# Altium project Ezlo_Voice_AssistantHUB.PrjPcb (part 4 of 10)

## Sheet Power_Sheet_3.SchDoc
size A4; DocumentNumber: 5; SheetNumber: 5; SheetTotal: 27
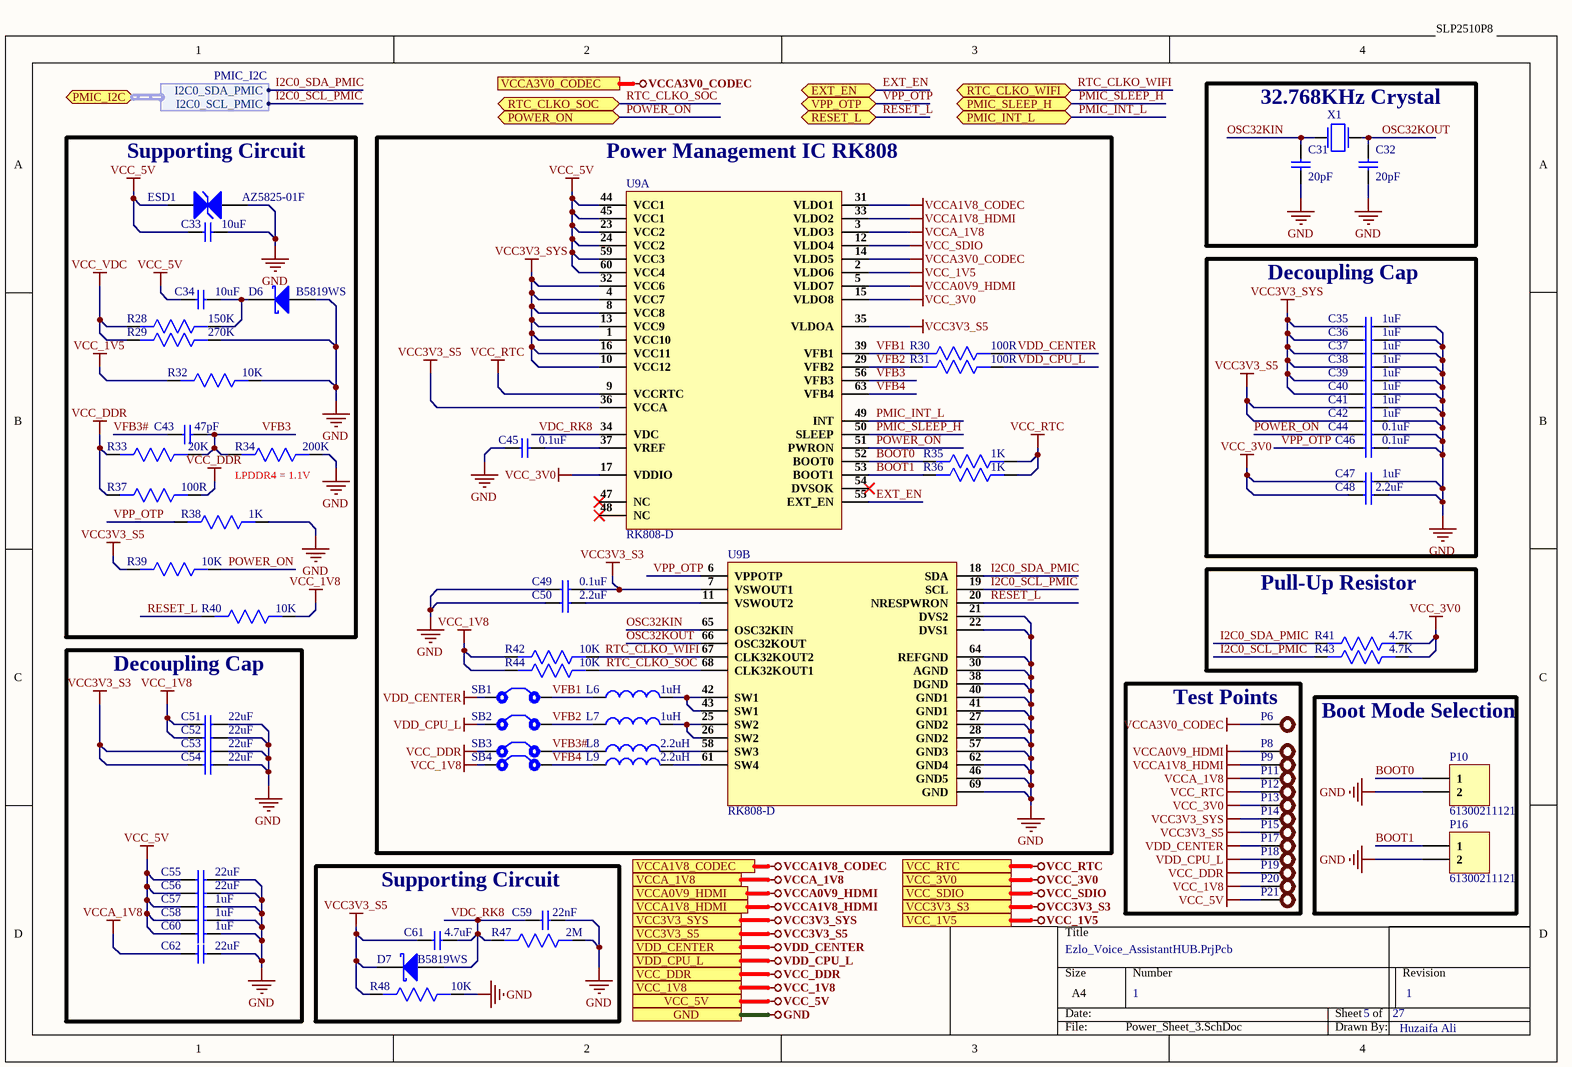
[diagram p6: Power_Sheet_3.SchDoc]

### Parts
C31  20pF  [Cap0603]
C32  20pF  [Cap0603]
C33  10uF  [Cap0603]
C34  10uF  [Cap0603]
C35  1uF  [Cap0402]
C36  1uF  [Cap0402]
C37  1uF  [Cap0402]
C38  1uF  [Cap0402]
C39  1uF  [Cap0402]
C40  1uF  [Cap0402]
C41  1uF  [Cap0402]
C42  1uF  [Cap0402]
C43  47pF  [Cap0603]
C44  0.1uF  [Cap 0402]
C45  0.1uF  [Cap0402]
C46  0.1uF  [Cap 0402]
C47  1uF  [Cap0402]
C48  2.2uF  [Cap0603]
C49  0.1uF  [Cap0402]
C50  2.2uF  [Cap0603]
C51  22uF  [Cap0805]
C52  22uF  [Cap0805]
C53  22uF  [Cap0805]
C54  22uF  [Cap0805]
C55  22uF  [Cap0805]
C56  22uF  [Cap0805]
C57  1uF  [Cap0402]
C58  1uF  [Cap0402]
C59  22nF  [Cap0603]
C60  1uF  [Cap0402]
C61  4.7uF  [Cap0603]
C62  22uF  [Cap0805]
D6  B5819WS  [SOD-323]
D7  B5819WS  [SOD-323]
ESD1  AZ5825-01F  [DFN1006-2L]
L6  1uH  [PSPMAA0412-1R0M-ANP]
L7  1uH  [PSPMAA0412-1R0M-ANP]
L8  2.2uH  [MHP0302-2R2M]
L9  2.2uH  [MHP0302-2R2M]
P6  TEST POINT  [TEST POINT]  (value not drawn)
P8  TEST POINT  [TEST POINT]  (value not drawn)
P9  TEST POINT  [TEST POINT]  (value not drawn)
P10  61300211121  [HDR1X2]
P11  TEST POINT  [TEST POINT]  (value not drawn)
P12  TEST POINT  [TEST POINT]  (value not drawn)
P13  TEST POINT  [TEST POINT]  (value not drawn)
P14  TEST POINT  [TEST POINT]  (value not drawn)
P15  TEST POINT  [TEST POINT]  (value not drawn)
P16  61300211121  [HDR1X2]
P17  Test Point  [TEST POINT]  (value not drawn)
P18  Test Point  [TEST POINT]  (value not drawn)
P19  Test Point  [TEST POINT]  (value not drawn)
P20  Test Point  [TEST POINT]  (value not drawn)
P21  Test Point  [TEST POINT]  (value not drawn)
R28  150K  [Res0603]
R29  270K  [Res0603]
R30  100R  [Res0603]
R31  100R  [Res0603]
R32  10K  [Res0603]
R33  20K  [Res0603]
R34  200K  [Res0603]
R35  1K  [Res0603]
R36  1K  [Res0603]
R37  100R  [Res0603]
R38  1K  [Res0603]
R39  10K  [Res0603]
R40  10K  [Res0603]
R41  4.7K  [Res0603]
R42  10K  [Res0603]
R43  4.7K  [Res0603]
R44  10K  [Res0603]
R47  2M  [Res0603]
R48  10K  [Res0603]
SB1  Solder Bridge  [Solder Bridge]  (value not drawn)
SB2  Solder Bridge  [Solder Bridge]  (value not drawn)
SB3  Solder Bridge  [Solder Bridge]  (value not drawn)
SB4  Solder Bridge  [Solder Bridge]  (value not drawn)
U9  RK808-D  [68-QFN (7x7)]  (parts A,B of 2)
X1  NX3215SA-32.768K-STD-MUA-8  [NX3215SA-32.768K-STD-MUA-8]  (value not drawn)

### Blocks framed on the sheet
32.768KHz Crystal: C31 C32 X1
Supporting Circuit: C33 C34 C43 D6 ESD1 R28 R29 R32-R34 R37-R40
Power Management IC RK808: C45 C49 C50 L6-L9 R30 R31 R35 R36 R42 R44 SB1-SB4 U9
Decoupling Cap: C35-C42 C44 C46-C48
Pull-Up Resistor: R41 R43
Decoupling Cap: C51-C58 C60 C62
Test Points: P6 P8 P9 P11-P15 P17-P21
Boot Mode Selection: P10 P16
Supporting Circuit: C59 C61 D7 R47 R48

### Ports
EXT_EN (bidir), GND, PMIC_I2C (bidir, harness PMIC_I2C), PMIC_INT_L (bidir), PMIC_SLEEP_H (bidir), POWER_ON (bidir), RESET_L (bidir), RTC_CLKO_SOC (bidir), RTC_CLKO_WIFI (bidir), VCC3V3_S3, VCC3V3_S5, VCC3V3_SYS, VCC_1V5, VCC_1V8, VCC_3V0, VCC_5V, VCC_DDR, VCC_RTC, VCC_SDIO, VCCA0V9_HDMI, VCCA1V8_CODEC, VCCA1V8_HDMI, VCCA3V0_CODEC, VCCA_1V8, VDD_CENTER, VDD_CPU_L, VPP_OTP (bidir)

### Harnesses
PMIC_I2C: I2C0_SDA_PMIC, I2C0_SCL_PMIC

### Nets
GND: C31.1 C32.1 C33.2 C35.2 C36.2 C37.2 C38.2 C39.2 C40.2 C41.2 C42.2 C44.2 C45.1 C46.2 C47.2 C48.2 C49.1 C50.1 C51.2 C52.2 C53.2 C54.2 C55.2 C56.2 C57.2 C58.2 C59.2 C60.2 C62.2 D6.2(A) ESD1.2(k) P10.2 P16.2 R29.1 R32.1 R34.1 R38.1 R47.1 R48.1 U9.21(DVS2) U9.22(DVS1) U9.27(GND2) U9.28(GND2) U9.30(AGND) U9.38(DGND) U9.40(GND1) U9.41(GND1) U9.46(GND5) U9.57(GND3) U9.62(GND4) U9.64(REFGND) U9.69(GND) ; port GND
VCC3V3_S3: C49.2 C53.1 C54.1 U9.7(VSWOUT1) ; port VCC3V3_S3
VCC3V3_S5: C41.1 C42.1 C61.1 D7.1(K) P15.1 R39.2 R48.2 U9.35(VLDOA) U9.36(VCCA) ; port VCC3V3_S5
VCC3V3_SYS: C35.1 C36.1 C37.1 C38.1 C39.1 C40.1 P14.1 U9.1(VCC10) U9.4(VCC7) U9.8(VCC8) U9.10(VCC12) U9.13(VCC9) U9.16(VCC11) U9.32(VCC6) ; port VCC3V3_SYS
VCC_1V5: R32.2 U9.2(VLDO6) ; port VCC_1V5
VCC_1V8: C51.1 C52.1 P20.1 R40.1 R42.2 R44.2 SB4.1 ; port VCC_1V8
VCC_3V0: C47.1 C48.1 P13.1 R41.1 R43.1 U9.15(VLDO8) U9.17(VDDIO) ; port VCC_3V0
VCC_5V: C33.1 C34.1 C55.1 C56.1 C57.1 C58.1 C60.1 ESD1.1(K) P21.1 U9.23(VCC2) U9.24(VCC2) U9.44(VCC1) U9.45(VCC1) U9.59(VCC3) U9.60(VCC4) ; port VCC_5V
VCC_DDR: P19.1 R33.2 R37.1 R37.2 SB3.1 ; port VCC_DDR
VCC_RTC: P12.1 R35.1 R36.1 U9.9(VCCRTC) ; port VCC_RTC
VCC_SDIO: U9.12(VLDO4) ; port VCC_SDIO
VCC_VDC: R28.2 R29.2
VCCA0V9_HDMI: P8.1 U9.5(VLDO7) ; port VCCA0V9_HDMI
VCCA1V8_CODEC: U9.31(VLDO1) ; port VCCA1V8_CODEC
VCCA1V8_HDMI: P9.1 U9.33(VLDO2) ; port VCCA1V8_HDMI
VCCA3V0_CODEC: P6.1 U9.14(VLDO5) ; port VCCA3V0_CODEC
VCCA_1V8: C62.1 P11.1 U9.3(VLDO3) ; port VCCA_1V8
VDD_CENTER: P17.1 R30.1 SB1.1 ; port VDD_CENTER
VDD_CPU_L: P18.1 R31.1 SB2.1 ; port VDD_CPU_L
BOOT0: P10.1 R35.2 U9.52(BOOT0)
BOOT1: P16.1 R36.2 U9.53(BOOT1)
EXT_EN: U9.55(EXT_EN) ; port EXT_EN
I2C0_SCL_PMIC: R43.2 U9.19(SCL) ; port PMIC_I2C.I2C0_SCL_PMIC
I2C0_SDA_PMIC: R41.2 U9.18(SDA) ; port PMIC_I2C.I2C0_SDA_PMIC
OSC32KIN: C31.2 U9.65(OSC32KIN) X1.2
OSC32KOUT: C32.2 U9.66(OSC32KOUT) X1.1
PMIC_INT_L: U9.49(INT) ; port PMIC_INT_L
PMIC_SLEEP_H: U9.50(SLEEP) ; port PMIC_SLEEP_H
POWER_ON: C44.1 R39.1 U9.51(PWRON) ; port POWER_ON
RESET_L: R40.2 U9.20(NRESPWRON) ; port RESET_L
RTC_CLKO_SOC: R44.1 U9.68(CLK32KOUT1) ; port RTC_CLKO_SOC
RTC_CLKO_WIFI: R42.1 U9.67(CLK32KOUT2) ; port RTC_CLKO_WIFI
VDC_RK8: C59.1 C61.2 D7.2(A) R47.2 U9.34(VDC)
VFB1: L6.1 R30.2 SB1.2 U9.39(VFB1)
VFB2: L7.1 R31.2 SB2.2 U9.29(VFB2)
VFB3: C43.2 R33.1 R34.2 U9.56(VFB3)
VFB3#: C43.1 L8.1 SB3.2
VFB4: L9.1 SB4.2 U9.63(VFB4)
VPP_OTP: C46.1 R38.2 U9.6(VPPOTP) ; port VPP_OTP
NetC34_2: C34.2 D6.1(K) R28.1
NetC45_2: C45.2 U9.37(VREF)
NetC50_2: C50.2 U9.11(VSWOUT2)
NetL6_2: L6.2 U9.42(SW1) U9.43(SW1)
NetL7_2: L7.2 U9.25(SW2) U9.26(SW2)
NetL8_2: L8.2 U9.58(SW3)
NetL9_2: L9.2 U9.61(SW4)

Not connected (* = marked no-connect by the designer): U9 47(NC)* 48(NC)* 54(DVSOK)*

### Notes on the sheet
- SLP2510P8
- (near R34) LPDDR4 = 1.1V
- 1
- Huzaifa Ali

### Library data of the parts
C31 C32 = CC0603JRNPO9BN200: CAP CER 20PF 50V C0G/NPO 0603; Manufacturer: Yageo; Tolerance: 5%; Dielectric: C0G; Supplier 1: Digi-Key; Manufacturer Part Number: CC0603JRNPO9BN200; Stock 1: 259568; Pricing 1: 1=0.1, 10=0.048, 100=0.0214, 500=0.01526, 1000=0.01198 (USD); Mount: Surface Mount; Case/Package: 0603; Number of Pins: 2; Weight: 7.1E-05oz; Case Code (Imperial): 0603; Case Code (Metric): 1608; Min Operating Temperature: -55°C; Max Operating Temperature: 125°C; Capacitance: 20pF; Package Quantity: 4000; Voltage Rating (DC): 50V; Packaging: Tape and Reel; Voltage Rating: 50V; Termination: SMD/SMT; Composition: Ceramic; Length: 1.6mm; Width: 0.8mm; Thickness: 0.035inch; Depth: 0.8mm; REACH SVHC: Unknown; Lead Free: Lead Free; ComponentLink1URL: http://www.farnell.com/datasheets/1132289.pdf?src-supplier=Element14; ComponentLink1Description: http://www.farnell.com/datasheets/1132289.pdf?src-supplier=Element14; ComponentLink2URL: http://www.yageo.com/documents/recent/UPY-GP_NP0_16V-to-50V_16.pdf?src-supplier=Digi-Key; ComponentLink2Description: http://www.yageo.com/documents/recent/UPY-GP_NP0_16V-to-50V_16.pdf?src-supplier=Digi-Key; Supplier Part Number 1: 311-1424-6-ND
C33 C34 = C1608X5R1E106M080AC: CAP CER 10UF 25V X5R 0603; Manufacturer: TDK; Dielectric Material: Ceramic; Tolerance: 20%; Supplier 1: Digi-Key; Manufacturer Part Number: C1608X5R1E106M080AC; Stock 1: 61681; Pricing 1: 1=0.96, 10=0.704, 100=0.483, 500=0.38238, 1000=0.322 (USD); Mount: Surface Mount; Case/Package: 0603; Weight: 7.1E-05oz; Case Code (Imperial): 0603; Case Code (Metric): 1608; Min Operating Temperature: -55°C; Max Operating Temperature: 85°C; Capacitance: 10uF; Packaging: Tape and Reel; Voltage Rating: 25V; Voltage Rating (DC): 25V; Termination: SMD/SMT; Package Quantity: 1; Dielectric: X5R; Composition: Ceramic; Length: 1.6mm; Height: 0.8mm; Width: 0.8mm; Thickness: 0.039inch; Depth: 0.8mm; Lead Free: Lead Free; REACH SVHC: No SVHC; Supplier Part Number 1: 445-9015-1-ND
C35-C42 C47 C57 C58 C60 = GRM155R61E105KA12D: CAP CER 1UF 25V X5R 0402; Manufacturer: Murata; Material: Ceramic; Tolerance: 10%; Supplier 1: Digi-Key; Manufacturer Part Number: GRM155R61E105KA12D; Stock 1: 1194305; Pricing 1: 1=0.11, 10=0.077, 100=0.0363, 500=0.02546, 1000=0.02108, 2500=0.01962, 5000=0.01795 (USD); Mount: Surface Mount; Case/Package: 0402; Weight: 0.000212oz; Case Code (Metric): 1005; Case Code (Imperial): 0402; Min Operating Temperature: -55°C; Max Operating Temperature: 85°C; Capacitance: 1uF; Voltage Rating: 25V; Packaging: Tape and Reel; Dielectric: X5R; Voltage: 25V; Termination: SMD/SMT; Voltage Rating (DC): 25V; Package Quantity: 10000; Length: 1mm; Height: 0.5mm; Width: 0.5mm; Thickness: 0.022inch; Depth: 0.5mm; REACH SVHC: No SVHC; Lead Free: Lead Free; ComponentLink1URL: http://www.farnell.com/datasheets/2048341.pdf?src-supplier=Element14; ComponentLink1Description: http://www.farnell.com/datasheets/2048341.pdf?src-supplier=Element14; Supplier Part Number 1: 490-10017-1-ND
C43 = AC0603JRNPO0BN470: CAP CER 47PF 100V NPO 0603; Manufacturer: Yageo; Zener Voltage: 33V; Tolerance: 6.06%; Max Power Dissipation: 250mW; Impedance: 80R; Supplier 1: Digi-Key; Manufacturer Part Number: AC0603JRNPO0BN470; Stock 1: 4954; Pricing 1: 1=0.16, 10=0.115, 100=0.0542, 500=0.03798, 1000=0.03144 (USD); Mount: Surface Mount; Case/Package: TO-236-3; Case Code (Imperial): 0603; Case Code (Metric): 1608; Min Operating Temperature: -55°C; Max Operating Temperature: 125°C; Packaging: Tape and Reel; Capacitance: 47pF; Voltage Rating: 100V; Ratings: AEC-Q200; ComponentLink1URL: http://www.yageo.com/NewPortal/_en/search/productDocs.jsp?YageoPartNumber=AC0603JRNPO0BN470&src-supplier=Digi-Key; ComponentLink1Description: http://www.yageo.com/NewPortal/_en/search/productDocs.jsp?YageoPartNumber=AC0603JRNPO0BN470&src-supplier=Digi-Key; Supplier Part Number 1: 311-3086-1-ND
C44 C46 = GRM155R71H104ME14D: CAP CER 0.1UF 50V X7R 0402; Manufacturer: Murata; Tolerance: 20%; Capacitance: 100nF; Supplier 1: Digi-Key; Manufacturer Part Number: GRM155R71H104ME14D; Stock 1: 439844; Pricing 1: 1=0.1, 10=0.038, 100=0.0168, 500=0.01198, 1000=0.00941, 2500=0.00855, 5000=0.00787 (USD); Mount: Surface Mount; Case/Package: 0402; Min Operating Temperature: -55°C; Max Operating Temperature: 125°C; Packaging: Cut Tape; Voltage Rating: 50V; Length: 0.039inch; Width: 0.02inch; Thickness: 0.022inch; ComponentLink1URL: http://search.murata.co.jp/Ceramy/image/img/A01X/G101/ENG/GRM155R71H104ME14-01.pdf?src-supplier=Digi-Key; ComponentLink1Description: http://search.murata.co.jp/Ceramy/image/img/A01X/G101/ENG/GRM155R71H104ME14-01.pdf?src-supplier=Digi-Key; ComponentLink2URL: http://psearch.en.murata.com/capacitor/product/GRM155R71H104ME14%23.pdf?src-supplier=Avnet; ComponentLink2Description: http://psearch.en.murata.com/capacitor/product/GRM155R71H104ME14%23.pdf?src-supplier=Avnet; ComponentLink3URL: http://components.arrow.com/part/dataview/0323_07177683?src-supplier=Arrow+Europe; ComponentLink3Description: http://components.arrow.com/part/dataview/0323_07177683?src-supplier=Arrow+Europe; ComponentLink4URL: http://www.mouser.com/ds/2/281/c02e-2905.pdf?src-supplier=Mouser; ComponentLink4Description: http://www.mouser.com/ds/2/281/c02e-2905.pdf?src-supplier=Mouser; Supplier Part Number 1: 490-10701-1-ND
C45 C49 = CC0402KRX5R6BB104: CAP CER 0.1UF 10V X5R 0402; Manufacturer: Yageo; Capacitance: 100nF; Tolerance: 10%; Dissipation Factor: 5%; Insulation Resistance: 10GR; Supplier 1: Digi-Key; Manufacturer Part Number: CC0402KRX5R6BB104; RoHS: Yes; Category: Ceramic Capacitors; Stock 1: 6385580; Pricing 1: 1=0.10000, 10=0.02700, 50=0.01500, 100=0.01220, 500=0.00874, 1000=0.00687, 2500=0.00625, 5000=0.00575 (USD); Mount: Surface Mount; Case/Package: 0402; Number of Pins: 2; Case Code (Imperial): 0402; Case Code (Metric): 1005; Min Operating Temperature: -55°C; Max Operating Temperature: 85°C; Dielectric: X5R; Packaging: Tape and Reel; Voltage Rating: 10V; Package Quantity: 1; Termination: SMD/SMT; Voltage Rating (DC): 10V; Series: CC; Length: 1mm; Width: 0.02inch; Height: 0.5mm; Depth: 0.5mm; Thickness: 0.022inch; Radiation Hardening: No; RoHS Compliant: Yes; REACH SVHC: No SVHC; Lead Free: Lead Free; Halogen Free: Halogen Free; ComponentLink1URL: https://datasheet.ciiva.com/144/mlccorderingcode-144029.pdf?src-supplier=Digi-Key; ComponentLink1Description: https://datasheet.ciiva.com/144/mlccorderingcode-144029.pdf?src-supplier=Digi-Key; ComponentLink2URL: https://datasheet.ciiva.com/144/mlccorderingcode-144028.pdf?src-supplier=Digi-Key; ComponentLink2Description: https://datasheet.ciiva.com/144/mlccorderingcode-144028.pdf?src-supplier=Digi-Key; ComponentLink3URL: https://datasheet.ciiva.com/144/mlccorderingcode-144030.pdf?src-supplier=Digi-Key; ComponentLink3Description: https://datasheet.ciiva.com/144/mlccorderingcode-144030.pdf?src-supplier=Digi-Key; ComponentLink4URL: https://datasheet.ciiva.com/7978/1359354-7978091.pdf?src-supplier=Element14; ComponentLink4Description: https://datasheet.ciiva.com/7978/1359354-7978091.pdf?src-supplier=Element14; ComponentLink5URL: https://datasheet.ciiva.com/11587/upy-gphc-x5r-4v-to-50v-12-11587302.pdf?src-supplier=Avnet; ComponentLink5Description: https://datasheet.ciiva.com/11587/upy-gphc-x5r-4v-to-50v-12-11587302.pdf?src-supplier=Avnet; Supplier Part Number 1: 311-1336-1-ND
C48 C50 = CL10A225KA8NNNC: CAP CER 2.2UF 25V X5R 0603; Manufacturer: Samsung; Tolerance: 10%; Supplier 1: Digi-Key; Manufacturer Part Number: CL10A225KA8NNNC; RoHS: Yes; Category: Ceramic Capacitors; Stock 1: 168888; Pricing 1: 1=0.22000, 10=0.15000, 50=0.09000, 100=0.07610, 500=0.05206, 1000=0.04605 (USD); Mount: Surface Mount; Case/Package: 0603; Case Code (Metric): 1608; Case Code (Imperial): 0603; Min Operating Temperature: -55°C; Max Operating Temperature: 85°C; Capacitance: 2.2uF; Packaging: Tape and Reel; Package Quantity: 1; Voltage Rating: 25V; Dielectric: X5R; Voltage Rating (DC): 25V; Series: CL; Construction: Flat; Length: 1.6mm; Width: 0.031inch; Height: 0.8mm; Thickness: 0.035inch; Depth: 0.8mm; Radiation Hardening: No; Lead Free: Lead Free; RoHS Compliant: Yes; ComponentLink1URL: https://datasheet.ciiva.com/25797/cl10a225ka8nnnc-25797781.pdf?src-supplier=Digi-Key; ComponentLink1Description: https://datasheet.ciiva.com/25797/cl10a225ka8nnnc-25797781.pdf?src-supplier=Digi-Key; Supplier Part Number 1: 1276-1879-1-ND
C51-C56 C62 = CL21A226MAYNNNE: 0803 22uF 25V X5R 20% multilayer ceramic capacitor; Manufacturer: Samsung; Supplier 1: Digi-Key; Manufacturer Part Number: CL21A226MAYNNNE; RoHS: Yes; Category: Ceramic Capacitors; Stock 1: 442950; Pricing 1: 2000=0.07687, 4000=0.07110, 10000=0.06726, 14000=0.06380, 50000=0.05765 (USD); RoHS Compliant: Yes; Supplier Part Number 1: 1276-CL21A226MAYNNNETR-ND
C59 = CC0603KRX7R9BB223: CAP CER 0.022UF 50V X7R 0603; Manufacturer: Yageo; Dielectric Material: Ceramic; Tolerance: 10%; Insulation Resistance: 100GR; Supplier 1: Digi-Key; Manufacturer Part Number: CC0603KRX7R9BB223; RoHS: Yes; Category: Ceramic Capacitors; Stock 1: 119735; Pricing 1: 1=0.10000, 10=0.05500, 50=0.03020, 100=0.02460, 500=0.01760, 1000=0.01383 (USD); Mount: Surface Mount; Case/Package: 0603; Number of Pins: 2; Case Code (Metric): 1608; Case Code (Imperial): 0603; Min Operating Temperature: -55°C; Max Operating Temperature: 125°C; Capacitance: 22nF; Dielectric: X7R; Voltage: 50V; Package Quantity: 1; Voltage Rating: 50V; Packaging: Tape and Reel; Voltage Rating (DC): 50V; Termination: SMD/SMT; Resistor Type: Ceramic; Series: CC; Length: 1.6mm; Width: 0.031inch; Height: 0.8mm; Depth: 0.8mm; Thickness: 0.035inch; Radiation Hardening: No; RoHS Compliant: Yes; REACH SVHC: No SVHC; Lead Free: Lead Free; Halogen Free: Halogen Free; ComponentLink1URL: https://datasheet.ciiva.com/8033/70765-8033869.pdf?src-supplier=Element14; ComponentLink1Description: https://datasheet.ciiva.com/8033/70765-8033869.pdf?src-supplier=Element14; ComponentLink2URL: https://datasheet.ciiva.com/28450/1489800-28450639.pdf?src-supplier=Element14; ComponentLink2Description: https://datasheet.ciiva.com/28450/1489800-28450639.pdf?src-supplier=Element14; ComponentLink3URL: https://datasheet.ciiva.com/8033/1489800-8033867.pdf?src-supplier=Element14; ComponentLink3Description: https://datasheet.ciiva.com/8033/1489800-8033867.pdf?src-supplier=Element14; ComponentLink4URL: https://datasheet.ciiva.com/8033/1489800-8033865.pdf?src-supplier=Element14; ComponentLink4Description: https://datasheet.ciiva.com/8033/1489800-8033865.pdf?src-supplier=Element14; ComponentLink5URL: https://datasheet.ciiva.com/156/mlccorderingcode-156178.pdf?src-supplier=Digi-Key; ComponentLink5Description: https://datasheet.ciiva.com/156/mlccorderingcode-156178.pdf?src-supplier=Digi-Key; ComponentLink6URL: https://datasheet.ciiva.com/156/mlccorderingcode-156177.pdf?src-supplier=Digi-Key; ComponentLink6Description: https://datasheet.ciiva.com/156/mlccorderingcode-156177.pdf?src-supplier=Digi-Key; ComponentLink7URL: https://datasheet.ciiva.com/156/mlccorderingcode-156179.pdf?src-supplier=Digi-Key; ComponentLink7Description: https://datasheet.ciiva.com/156/mlccorderingcode-156179.pdf?src-supplier=Digi-Key; ComponentLink8URL: https://datasheet.ciiva.com/11464/upy-gphc-x7r-6-3v-to-50v-8-11464741.pdf?src-supplier=Avnet; ComponentLink8Description: https://datasheet.ciiva.com/11464/upy-gphc-x7r-6-3v-to-50v-8-11464741.pdf?src-supplier=Avnet; Supplier Part Number 1: 311-1370-1-ND
C61 = CL10A475KA8NQNC: CAP CER 4.7UF 25V X5R 0603; Manufacturer: Samsung; Tolerance: 10%; Supplier 1: Arrow Electronics; Manufacturer Part Number: CL10A475KA8NQNC; RoHS: Yes; Category: Ceramic Capacitors; Stock 1: 260000; Pricing 1: 4000=0.08490, 8000=0.05240, 16000=0.05180, 24000=0.05130, 40000=0.05070 (USD); Mount: Surface Mount; Case/Package: 0603; Case Code (Metric): 1608; Case Code (Imperial): 0603; Contact Plating: Tin; Min Operating Temperature: -55°C; Max Operating Temperature: 85°C; Package Quantity: 1; Packaging: Tape and Reel; Capacitance: 4.7uF; Voltage Rating: 25V; Dielectric: X5R; Series: CL; Termination: Wraparound; Construction: Flat; Length: 1.6mm; Width: 0.031inch; Thickness: 0.035inch; Depth: 0.8mm; Lead Free: Lead Free; RoHS Compliant: Yes; ComponentLink1URL: https://datasheet.ciiva.com/25787/cl10a475ka8nqnc-25787017.pdf?src-supplier=Digi-Key; ComponentLink1Description: https://datasheet.ciiva.com/25787/cl10a475ka8nqnc-25787017.pdf?src-supplier=Digi-Key; Supplier Part Number 1: CL10A475KA8NQNC
D6 D7 = B5819WS: DIODE SCHOTTKY 40V 1A SOD323; Manufacturer: MDD; Manufacturer Part Number: B5819WS-TP; Max Surge Current: 10A; Forward Voltage: 900mV; Max Reverse Leakage Current: 1mA; Element Configuration: Single; Supplier 1: Arrow Electronics; RoHS: Yes; Category: Rectifier Diodes; Stock 1: 1701; Pricing 1: 1=0.34370, 10=0.18990, 25=0.18810, 100=0.11820, 250=0.11700, 500=0.08890, 1000=0.07420 (USD); Mount: Surface Mount; Number of Pins: 2; Min Operating Temperature: -65°C; Max Operating Temperature: 125°C; Package Quantity: 1; Packaging: Tape and Reel; Average Rectified Current: 1A; Peak Non-Repetitive Surge Current: 10A; Max Reverse Voltage (DC): 40V; Series: -; Radiation Hardening: No; RoHS Compliant: Yes; Lead Free: Lead Free; Supplier Part Number 1: B5819WS-TP; ComponentLink1Description: LCSC; ComponentLink1URL: https://lcsc.com/product-detail/Schottky-Barrier-Diodes-SBD_MDD-Microdiode-Electronics-B5819WS_C64886.html
ESD1 = AZ5825-01F: DFN1006P ESD Protection Devices ROHS; Manufacturer: TECH PUBLIC; ComponentLink1Description: LCSC; ComponentLink1URL: https://lcsc.com/product-detail/ESD-Protection-Devices_TECH-PUBLIC-AZ5825-01F_C2905641.html; Package: FN1006P
L6 L7 = PSPMAA0412-1R0M-ANP: 4.5A 1uH ±20% 70mΩ 5.5A SMD,4.2x4.4x1.2mm Power Inductors ROHS; Manufacturer: PROD Tech; ComponentLink1Description: LCSC; ComponentLink1URL: https://lcsc.com/product-detail/Power-Inductors_PROD-Tech-PSPMAA0412-1R0M-ANP_C705331.html; Manufacturer Part Number: PSPMAA0412-1R0M-ANP; Footprint: Custom
L8 L9 = MHP0302-2R2M: 2.8A 2.2uH ±20% 60mΩ 4A SMD,3.4x3x1.8mm Power Inductors ROHS; Manufacturer: Me-TECH; Manufacturer Part Number: MHP0302-2R2M; Footprint: Custom; ComponentLink1Description: LCSC; ComponentLink1URL: https://lcsc.com/product-detail/Power-Inductors_Me-TECH-MHP0302-2R2M_C2934937.html
P6 P8 P9 P11-P15 P17-P21 = TEST POINT: Test Point ON
P10 P16 = 61300211121: CONN HEADER VERT 2POS 2.54MM; Manufacturer: Wurth Electronics; Current Rating: 3A; Voltage Rating: 250V; Number of Positions: 2; Gender: Male; Connector Type: Male Pin; Pitch: 0.1inch; Supplier 1: Digi-Key; Manufacturer Part Number: 61300211121; Stock 1: 219205; Pricing 1: 1=0.13, 10=0.106, 25=0.088, 50=0.074, 100=0.067, 1000=0.061 (USD); Mount: Through Hole; Contact Plating: Gold; Housing Material: PBT; Contact Material: Copper Alloy,Copper; Color: Black; Min Operating Temperature: -40°C; Max Operating Temperature: 125°C; Number of Rows: 1; Contact Gender: Male; Packaging: Bulk; Termination: Through Hole; Number of Contacts: 2; Contact Mating Length: 0.236inch; REACH SVHC: Unknown; Lead Free: Lead Free; ComponentLink1URL: http://www.mouser.com/ds/2/445/6130xx11121-538006.pdf?src-supplier=Mouser; ComponentLink1Description: http://www.mouser.com/ds/2/445/6130xx11121-538006.pdf?src-supplier=Mouser; Supplier Part Number 1: 732-5315-ND
R28 = ERJPA3J154V: Res Thick Film 0603 150K Ohm 5% 0.25W(1/4W) ±200ppm/C Pad SMD Automotive T/R; Manufacturer: Panasonic; Manufacturer Part Number: ERJ-PA3J154V; Resistance: 150kR; Max Power Dissipation: 250mW; Temperature Coefficient: 200ppm/°C; Supplier 1: Arrow Electronics; RoHS: Yes; Category: Chip SMD Resistors; Stock 1: 30; Pricing 1: 1=0.09570, 10=0.08790, 100=0.03390, 1000=0.01520, 2500=0.01310, 5000=0.01070 (USD); Case/Package: 0603; Case Code (Imperial): 0603; Case Code (Metric): 1608; Min Operating Temperature: -55°C; Max Operating Temperature: 155°C; Features: Automotive AEC-Q200; Tolerance: 5%; Packaging: Tape and Reel; Resistor Type: Thick Film; Number of Terminations: 2; Length: 0.063inch; Width: 0.031inch; Height: 0.018inch; ComponentLink1URL: https://industrial.panasonic.com/cdbs/www-data/pdf/RDO0000/AOA0000C331.pdf?src-supplier=Digi-Key; ComponentLink1Description: https://industrial.panasonic.com/cdbs/www-data/pdf/RDO0000/AOA0000C331.pdf?src-supplier=Digi-Key; Supplier Part Number 1: ERJ-PA3J154V
R29 = RC0603JR-07270KL: Res Thick Film 0603 270K Ohm 5% 0.1W(1/10W) ±100ppm/C Pad SMD T/R; Manufacturer: Yageo; Resistance: 270kR; Temperature Coefficient: 100ppm/°C; Voltage Rating (DC): 50V; Power Rating: 100mW; Working Voltage: 75V; Supplier 1: Arrow Electronics; Manufacturer Part Number: RC0603JR-07270KL; RoHS: Yes; Category: Chip SMD Resistors; Stock 1: 910; Pricing 1: 1=0.04100, 10=0.00590, 100=0.00230 (USD); Case/Package: 0603; Number of Pins: 2; Case Code (Imperial): 0603; Case Code (Metric): 1608; Min Operating Temperature: -55°C; Max Operating Temperature: 155°C; Tolerance: 5%; Resistor Type: Thick Film; Packaging: Tape and Reel; Voltage Rating: 50V; Termination: SMD/SMT; Number of Terminations: 2; Features: Moisture Resistant; Series: RC; Max Power Dissipation: 100mW; Resistance Tolerance: 5%; Construction: Rectangular; Length: 1.6mm; Width: 0.8mm; Height: 0.45mm; Depth: 0.8mm; REACH SVHC: No SVHC; Lead Free: Lead Free; Military Standard: Not; RoHS Compliant: Yes; ComponentLink1URL: https://datasheet.ciiva.com/22643/1868787-22643417.pdf?src-supplier=Element14; ComponentLink1Description: https://datasheet.ciiva.com/22643/1868787-22643417.pdf?src-supplier=Element14; ComponentLink2URL: https://datasheet.ciiva.com/12558/rc0603-272842-12558662.pdf?src-supplier=Mouser; ComponentLink2Description: https://datasheet.ciiva.com/12558/rc0603-272842-12558662.pdf?src-supplier=Mouser; ComponentLink3URL: https://datasheet.ciiva.com/7746/443971-7746474.pdf?src-supplier=Element14; ComponentLink3Description: https://datasheet.ciiva.com/7746/443971-7746474.pdf?src-supplier=Element14; ComponentLink4URL: https://datasheet.ciiva.com/7746/443971-7746473.pdf?src-supplier=Element14; ComponentLink4Description: https://datasheet.ciiva.com/7746/443971-7746473.pdf?src-supplier=Element14; Supplier Part Number 1: RC0603JR-07270KL
R30 R31 R37 = FRC0603J101 TS: 100mW Thick Film Resistors 50V ±5% ±100ppm/℃ -55℃~+155℃ 100Ω 0603 Chip Resistor - Surface Mount ROHS; Manufacturer: FOJAN; Manufacturer Part Number: FRC0603J101 TS; Value: 100R; Footprint: 0603
R32 R39 R40 R42 R44 R48 = AC0603JR-0710KL: RES SMD 10K OHM 5% 1/10W 0603; Manufacturer: Yageo; Voltage Rating: 50V; Resistance: 10kR; Power Rating: 100mW; Temperature Coefficient: 100ppm/°C; Supplier 1: Future Electronics; Manufacturer Part Number: AC0603JR-0710KL; RoHS: Yes; Category: Chip SMD Resistors; Stock 1: 1533000; Pricing 1: 5000=0.00540 (USD); Case/Package: 0603; Case Code (Imperial): 0603; Case Code (Metric): 1608; Size Code: 0603; Min Operating Temperature: -55°C; Max Operating Temperature: 155°C; Packaging: Tape and Reel; Tolerance: 5%; Package Quantity: 1; Resistor Type: Thick Film; Termination: SMD/SMT; Number of Terminations: 2; Max Power Dissipation: 100mW; Features: Moisture Resistant,Automotive AEC-Q200,Anti-Sulfur; Series: AC; Construction: Rectangular; Length: 0.063inch; Width: 0.031inch; Height: 0.022inch; Depth: 0.8mm; Military Standard: Not; Lead Free: Lead Free; RoHS Compliant: Yes; ComponentLink1URL: https://datasheet.ciiva.com/5562/pyu-ac-51-rohs-l-2-5562553.pdf?src-supplier=Mouser; ComponentLink1Description: https://datasheet.ciiva.com/5562/pyu-ac-51-rohs-l-2-5562553.pdf?src-supplier=Mouser; Supplier Part Number 1: 1029044
R33 = RC0603FR-0720KL: RES SMD 20K OHM 1% 1/10W 0603
R34 = RT0603DRD07200KL: RES SMD 200K OHM 0.5% 1/10W 0603; Manufacturer: Yageo; Voltage Rating: 75V; Resistance: 200kR; Power Rating: 100mW; Temperature Coefficient: 25ppm/°C; Voltage Rating (DC): 50V; Supplier 1: Digi-Key; Manufacturer Part Number: RT0603DRD07200KL; Stock 1: 88258; Pricing 1: 1=0.21, 10=0.174, 100=0.0682, 1000=0.02855, 2500=0.02617 (USD); Case/Package: 0603; Case Code (Metric): 1608; Case Code (Imperial): 0603; Min Operating Temperature: -55°C; Max Operating Temperature: 125°C; Tolerance: 0.5%; Packaging: Tape and Reel; Termination: SMD/SMT; Lead Free: Lead Free; Supplier Part Number 1: 311-200KDCT-ND
R35 R36 R38 = RT0603DRD071KL: RES SMD 1K OHM 0.5% 1/10W 0603; Manufacturer: Yageo; Resistance: 1kR; Temperature Coefficient: 25ppm/°C; Power Rating: 100mW; Voltage Rating: 75V; Voltage Rating (DC): 50V; Supplier 1: Digi-Key; Manufacturer Part Number: RT0603DRD071KL; Stock 1: 178947; Pricing 1: 1=0.2, 10=0.167, 100=0.0651, 1000=0.02725, 2500=0.02498 (USD); Case/Package: 0603; Contact Plating: Tin,Matte; Case Code (Metric): 1608; Case Code (Imperial): 0603; Min Operating Temperature: -55°C; Max Operating Temperature: 125°C; Tolerance: 0.5%; Composition: Thin Film; Packaging: Tape and Reel; Termination: SMD/SMT; Radiation Hardening: No; Lead Free: Lead Free; ComponentLink1URL: http://www.mouser.com/ds/2/447/yageodocoutput-1125656.pdf?src-supplier=Mouser; ComponentLink1Description: http://www.mouser.com/ds/2/447/yageodocoutput-1125656.pdf?src-supplier=Mouser; ComponentLink2URL: http://www.yageo.com/documents/recent/PYu-RT_1-to-0.05_RoHS_L_6.pdf?src-supplier=Avnet; ComponentLink2Description: http://www.yageo.com/documents/recent/PYu-RT_1-to-0.05_RoHS_L_6.pdf?src-supplier=Avnet; Supplier Part Number 1: 311-1.0KDDKR-ND
R41 R43 = RC0603JR-074K7L: RES SMD 4.7K OHM 5% 1/10W 0603; Manufacturer: Yageo; Resistance: 4.7kR; Temperature Coefficient: 100ppm/°C; Voltage Rating (DC): 50V; Power Rating: 100mW; Supplier 1: Digi-Key; Manufacturer Part Number: RC0603JR-074K7L; Stock 1: 19706643; Pricing 1: 1=0.1, 10=0.02, 100=0.0081, 1000=0.00362, 2500=0.00314 (USD); Case/Package: 0603; Number of Pins: 2; Case Code (Imperial): 0603; Case Code (Metric): 1608; Min Operating Temperature: -55°C; Max Operating Temperature: 155°C; Tolerance: 5%; Composition: Thick Film; Packaging: Tape and Reel; Voltage Rating: 50V; Termination: SMD/SMT; Military Standard: Not; Length: 1.6mm; Width: 0.8mm; Depth: 0.8mm; REACH SVHC: No SVHC; Lead Free: Lead Free; ComponentLink1URL: http://www.farnell.com/datasheets/443971.pdf?src-supplier=Element14; ComponentLink1Description: http://www.farnell.com/datasheets/443971.pdf?src-supplier=Element14; Supplier Part Number 1: 311-4.7KGRCT-ND
R47 = RC0603FR-072ML: RES 2M OHM 1% 1/10W 0603; Manufacturer: Yageo; Resistance: 2MR; Power Rating: 100mW; Voltage Rating: 75V; Temperature Coefficient: 100ppm/°C; Voltage Rating (DC): 50V; Supplier 1: Digi-Key; Manufacturer Part Number: RC0603FR-072ML; RoHS: Yes; Category: Chip SMD Resistors; Stock 1: 382342; Pricing 1: 1=0.10000, 10=0.02300, 100=0.00930, 1000=0.00417, 2500=0.00362 (USD); Mount: Surface Mount; Case/Package: 0603; Case Code (Imperial): 0603; Case Code (Metric): 1608; Weight: 7.1E-05oz; Size Code: 0603; Min Operating Temperature: -55°C; Max Operating Temperature: 155°C; Tolerance: 1%; Packaging: Tape and Reel; Package Quantity: 1; Termination: SMD/SMT; Resistor Type: Thick Film; Number of Terminations: 2; Max Power Dissipation: 100mW; Features: Moisture Resistant; Series: RC; Technology: THICK FILM; Length: 1.6mm; Width: 0.8mm; Height: 0.45mm; Depth: 0.8mm; Lead Free: Lead Free; RoHS Compliant: Yes; ComponentLink1URL: https://datasheet.ciiva.com/11808/0900766b80f96399-11808743.pdf?src-supplier=RSComponents; ComponentLink1Description: https://datasheet.ciiva.com/11808/0900766b80f96399-11808743.pdf?src-supplier=RSComponents; ComponentLink2URL: https://datasheet.ciiva.com/2454/pyu-r-int-thick-7-2454115.pdf?src-supplier=Digi-Key; ComponentLink2Description: https://datasheet.ciiva.com/2454/pyu-r-int-thick-7-2454115.pdf?src-supplier=Digi-Key; ComponentLink3URL: https://datasheet.ciiva.com/2454/pyu-r-int-thick-7-2454116.pdf?src-supplier=Digi-Key; ComponentLink3Description: https://datasheet.ciiva.com/2454/pyu-r-int-thick-7-2454116.pdf?src-supplier=Digi-Key; ComponentLink4URL: https://datasheet.ciiva.com/2454/pyu-r-int-thick-7-2454114.pdf?src-supplier=Digi-Key; ComponentLink4Description: https://datasheet.ciiva.com/2454/pyu-r-int-thick-7-2454114.pdf?src-supplier=Digi-Key; Supplier Part Number 1: 311-2.00MHRCT-ND
SB1-SB4 = Solder Bridge: Solder Bridge ON
U9 = RK808-D: RK808-D QFN-68 RK808 QFN68 K808 Power management chip New and original; Manufacturer: Rockchip; ComponentLink1Description: Aliexpress; ComponentLink1URL: https://www.aliexpress.com/item/4001077659208.html; Manufacturer Part Number: RK808-D; Footprint: QFN68
X1 = NX3215SA-32.768K-STD-MUA-8: CRYSTAL 32.7680KHZ 12.5PF SMD; Manufacturer: NDK; Frequency: 32.768kHz; Frequency Tolerance: 20ppm; ESR (Equivalent Series Resistance): 70kR; Supplier 1: Digi-Key; Manufacturer Part Number: NX3215SA-32.768K-STD-MUA-8; Stock 1: 29951; Pricing 1: 1=0.68, 10=0.602, 50=0.5628, 100=0.4974, 500=0.47124, 1000=0.3927 (USD); Mount: Surface Mount; Case/Package: SMD/SMT; Number of Pins: 2; Min Operating Temperature: -40°C; Max Operating Temperature: 85°C; Package Quantity: 1000; Load Capacitance: 12.5pF; Packaging: Tape and Reel; Length: 0.126inch; Height: 0.035inch; Width: 0.059inch; Lead Free: Lead Free; ComponentLink1URL: https://media.digikey.com/pdf/Data%20Sheets/NDK%20PDFs/NX3215SA-32.768K-STD-MUA-8.pdf?src-supplier=Digi-Key; ComponentLink1Description: https://media.digikey.com/pdf/Data%20Sheets/NDK%20PDFs/NX3215SA-32.768K-STD-MUA-8.pdf?src-supplier=Digi-Key; ComponentLink2URL: http://www.ndk.com/images/products/catalog/c_NX3215SA-STD-MUA-14_e.pdf?src-supplier=Digi-Key; ComponentLink2Description: http://www.ndk.com/images/products/catalog/c_NX3215SA-STD-MUA-14_e.pdf?src-supplier=Digi-Key; Supplier Part Number 1: 644-1156-6-ND